# Altium schematic sheet S4_Pwm_Ports.SchDoc
size 420 x 297 mm; SheetNumber: 4; SheetTotal: 8
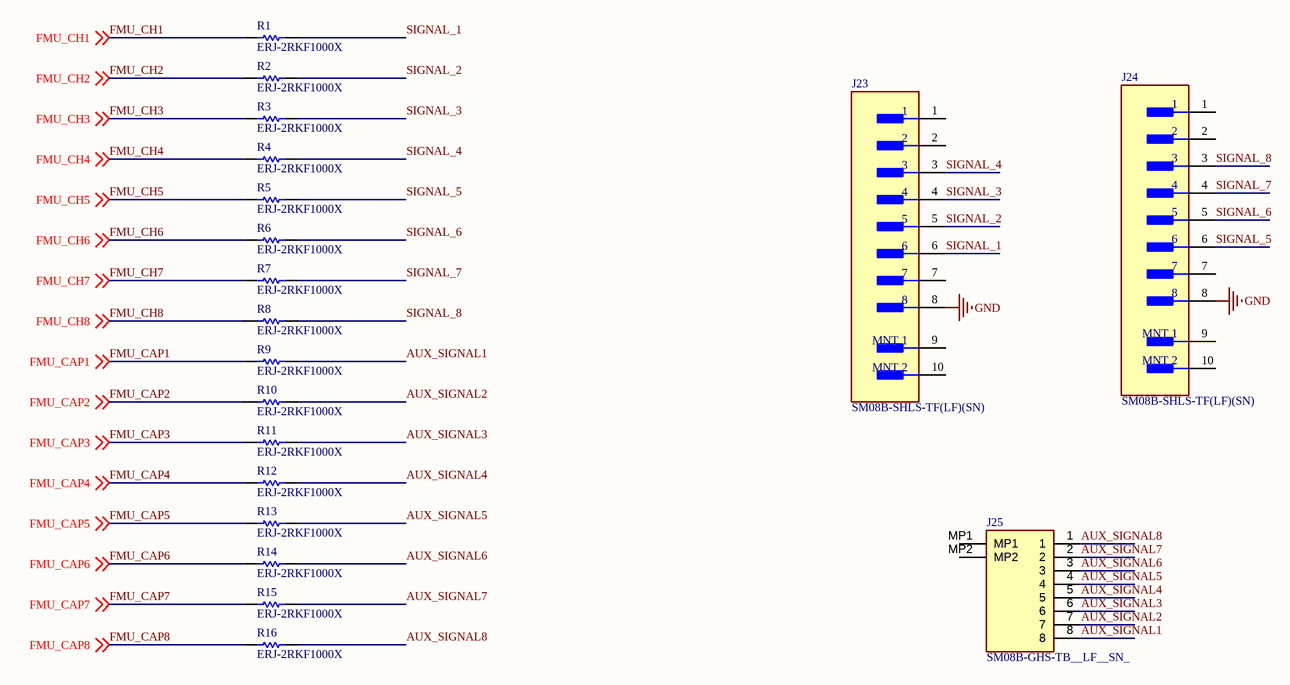
[diagram p0: S4_Pwm_Ports.SchDoc]

## Parts
J23  SM08B-SHLS-TF(LF)(SN)  [FP-SM08B-SHLS-TF_LF_SN-MFG]
J24  SM08B-SHLS-TF(LF)(SN)  [FP-SM08B-SHLS-TF_LF_SN-MFG]
J25  SM08B-GHS-TB__LF__SN_  [SM08BGHSTBLFSN]
R1  ERJ-2RKF1000X  [RESC1005X40X25LL05T05]
R2  ERJ-2RKF1000X  [RESC1005X40X25LL05T05]
R3  ERJ-2RKF1000X  [RESC1005X40X25LL05T05]
R4  ERJ-2RKF1000X  [RESC1005X40X25LL05T05]
R5  ERJ-2RKF1000X  [RESC1005X40X25LL05T05]
R6  ERJ-2RKF1000X  [RESC1005X40X25LL05T05]
R7  ERJ-2RKF1000X  [RESC1005X40X25LL05T05]
R8  ERJ-2RKF1000X  [RESC1005X40X25LL05T05]
R9  ERJ-2RKF1000X  [RESC1005X40X25LL05T05]
R10  ERJ-2RKF1000X  [RESC1005X40X25LL05T05]
R11  ERJ-2RKF1000X  [RESC1005X40X25LL05T05]
R12  ERJ-2RKF1000X  [RESC1005X40X25LL05T05]
R13  ERJ-2RKF1000X  [RESC1005X40X25LL05T05]
R14  ERJ-2RKF1000X  [RESC1005X40X25LL05T05]
R15  ERJ-2RKF1000X  [RESC1005X40X25LL05T05]
R16  ERJ-2RKF1000X  [RESC1005X40X25LL05T05]

## Nets
GND: J23.8 J24.8
AUX_SIGNAL1: J25.8 R9.2
AUX_SIGNAL2: J25.7 R10.2
AUX_SIGNAL3: J25.6 R11.2
AUX_SIGNAL4: J25.5 R12.2
AUX_SIGNAL5: J25.4 R13.2
AUX_SIGNAL6: J25.3 R14.2
AUX_SIGNAL7: J25.2 R15.2
AUX_SIGNAL8: J25.1 R16.2
FMU_CAP1: R9.1 ; off-sheet FMU_CAP1
FMU_CAP2: R10.1 ; off-sheet FMU_CAP2
FMU_CAP3: R11.1 ; off-sheet FMU_CAP3
FMU_CAP4: R12.1 ; off-sheet FMU_CAP4
FMU_CAP5: R13.1 ; off-sheet FMU_CAP5
FMU_CAP6: R14.1 ; off-sheet FMU_CAP6
FMU_CAP7: R15.1 ; off-sheet FMU_CAP7
FMU_CAP8: R16.1 ; off-sheet FMU_CAP8
FMU_CH1: R1.1 ; off-sheet FMU_CH1
FMU_CH2: R2.1 ; off-sheet FMU_CH2
FMU_CH3: R3.1 ; off-sheet FMU_CH3
FMU_CH4: R4.1 ; off-sheet FMU_CH4
FMU_CH5: R5.1 ; off-sheet FMU_CH5
FMU_CH6: R6.1 ; off-sheet FMU_CH6
FMU_CH7: R7.1 ; off-sheet FMU_CH7
FMU_CH8: R8.1 ; off-sheet FMU_CH8
SIGNAL_1: J23.6 R1.2
SIGNAL_2: J23.5 R2.2
SIGNAL_3: J23.4 R3.2
SIGNAL_4: J23.3 R4.2
SIGNAL_5: J24.6 R5.2
SIGNAL_6: J24.5 R6.2
SIGNAL_7: J24.4 R7.2
SIGNAL_8: J24.3 R8.2

Not connected (* = marked no-connect by the designer): J23 1 2 7 9(MNT_1) 10(MNT_2); J24 1 2 7 9(MNT_1) 10(MNT_2); J25 MP1 MP2

## Notes on the sheet
- THIS DOCUMENT AND THE DATA DISCLOSED HEREIN OR
- HEREWITH IS THE PROPERTY OF ALTIUM LIMITED AND MAY
- DWG NO:
- REVISION
- REV:
- DESCRIPTION
- DATE
- APPROVED
- BE FREELY DISTRIBUTED IN WHOLE. NO RIGHTS ARE
- RESERVED OR EXPRESS OR IMPLIED WARANTEE GIVEN.
- ENG:
- APPROVALS
- PROJECT
- DSN:
- CHK:
- REFERENCE DOCUMENTS
- PROJECT REVISION:
- TITLE
- DOCUMENT REVISION:
- DESIGN ITEM:
- BOM:
- FAB DWG:
- PCB DWG:
- ASSY DWG:
- SCALE:
- A3
- SIZE
- CAGE CODE
- FILE NAME
- DWG NO.
- SHEET
- OF
- REV

## Library data of the parts
J23 J24 = CMP-17439-000660-1: CONN HEADER SMD R/A 8POS 1MM; Number of Positions: 8; Voltage Rating: 50V; Contact Material: Bronze; Contact Shape: Rectangular; Insulation Material: Nylon; Min Operating Temperature: -25°C; Contact Type: Outer Shroud Contact; Packaging: Cut Tape; Termination: Solder; Series: SHL; Flammability Rating: UL94 V-0; Mount: Surface Mount; Insulation Color: Natural; Lead Free: Lead Free; Contact Finish - Mating: TIN; Fastening Type: Pull; Number of Rows: 1; Max Operating Temperature: 85°C; Connector Type: Header
J25 = SM08B-GHS-TB__LF__SN_: Connector; Manufacturer_Name: JST (JAPAN SOLDERLESS TERMINALS); Manufacturer_Part_Number: SM08B-GHS-TB (LF)(SN); Datasheet Link: https://www.arrow.com/en/products/sm08b-ghs-tb-lf-sn/jst-manufacturing; Height: 4.25mm; Arrow Part Number: SM08B-GHS-TB (LF)(SN); Arrow Price/Stock: https://www.arrow.com/en/products/sm08b-ghs-tb-lf-sn/jst-manufacturing
R1-R16 = CMP-2002-00605-3: Chip Resistor, 100 Ohm, +/- 1%, 100 mW, -55 to 155 degC, 0402 (1005 Metric), RoHS, Tape and Reel; Manufacturer: Basic Passives; Power Rating: 100 mW; Resistance: 100 Ohm; Voltage Rating: 50 V; Case\/Package: 0402; Width: 0.5 mm; Pins: 2; ComponentLink2Description: Datasheet; PackageReference: 0402; Height: 0.35 mm; Tolerance: 1%; DatasheetVersion: 04/2015; Case Code (Imperial): 0402; Min Operating Temperature: -55 degC; Radiation Hardening: No; Length: 1 mm; Package Quantity: 10000; PackageDescription: 2-Pin Surface Mount Device, Body 1 x 0.5 mm; Mounting Technology: Surface Mount; Case Code (Metric): 1005; Packaging: Tape and Reel; ComponentLink1URL: http://www.panasonic.com/; RoHSCompliant: true; Max Operating Temperature: 155 degC; REACH SVHC: Yes; PartNumber: ERJ-2RKF1000X; ComponentLink1Description: Manufacturer URL; ComponentLink2URL: http://industrial.panasonic.com/cdbs/www-data/pdf/RDA0000/AOA0000C86.pdf; Mount: Surface Mount